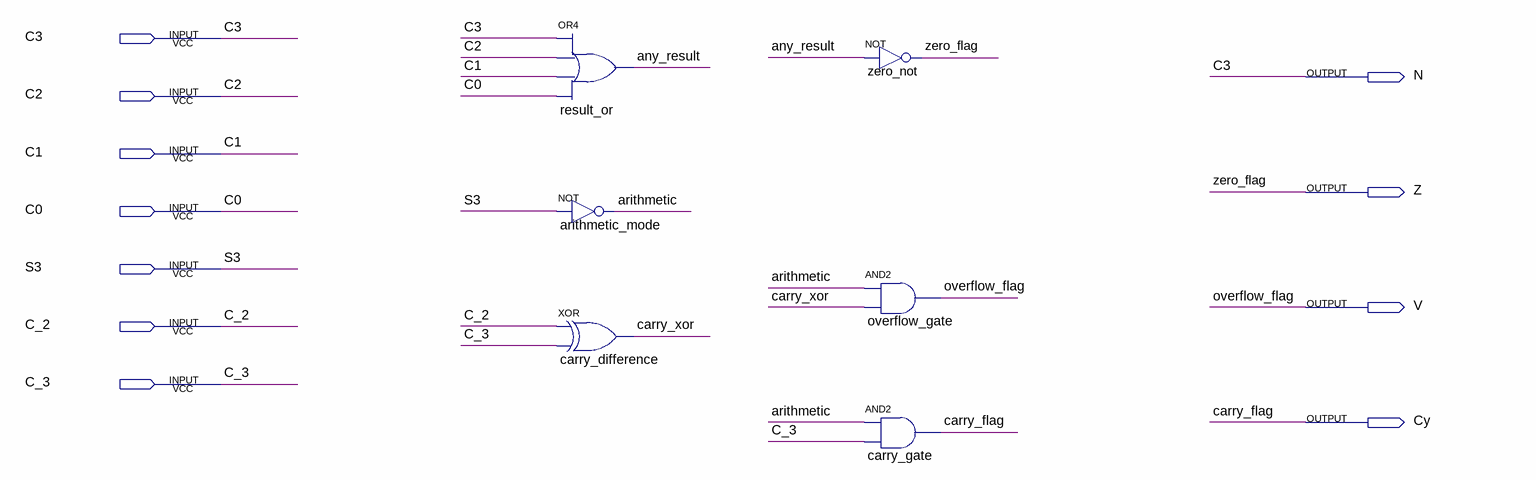
[diagram p0: schematic sheet]
// Quartus schematic state4bit.bdf as structural Verilog: 6 symbols, 11 pins
module state4bit (
  input  C3,
  input  C2,
  input  C1,
  input  C0,
  input  S3,
  input  C_2,
  input  C_3,
  output N,
  output Z,
  output V,
  output Cy
);

  wire any_result, arithmetic, carry_xor;

  or result_or (any_result, C3, C2, C1, C0);
  not arithmetic_mode (arithmetic, S3);
  xor carry_difference (carry_xor, C_2, C_3);
  not zero_not (Z, any_result);
  and overflow_gate (V, arithmetic, carry_xor);
  and carry_gate (Cy, arithmetic, C_3);

  assign N = C3;

  // Other names for the same wires on the sheet: carry_flag = Cy; overflow_flag = V; zero_flag = Z
endmodule
